# EAGLE design Sensor-node_max (EAGLE 9.6.2)
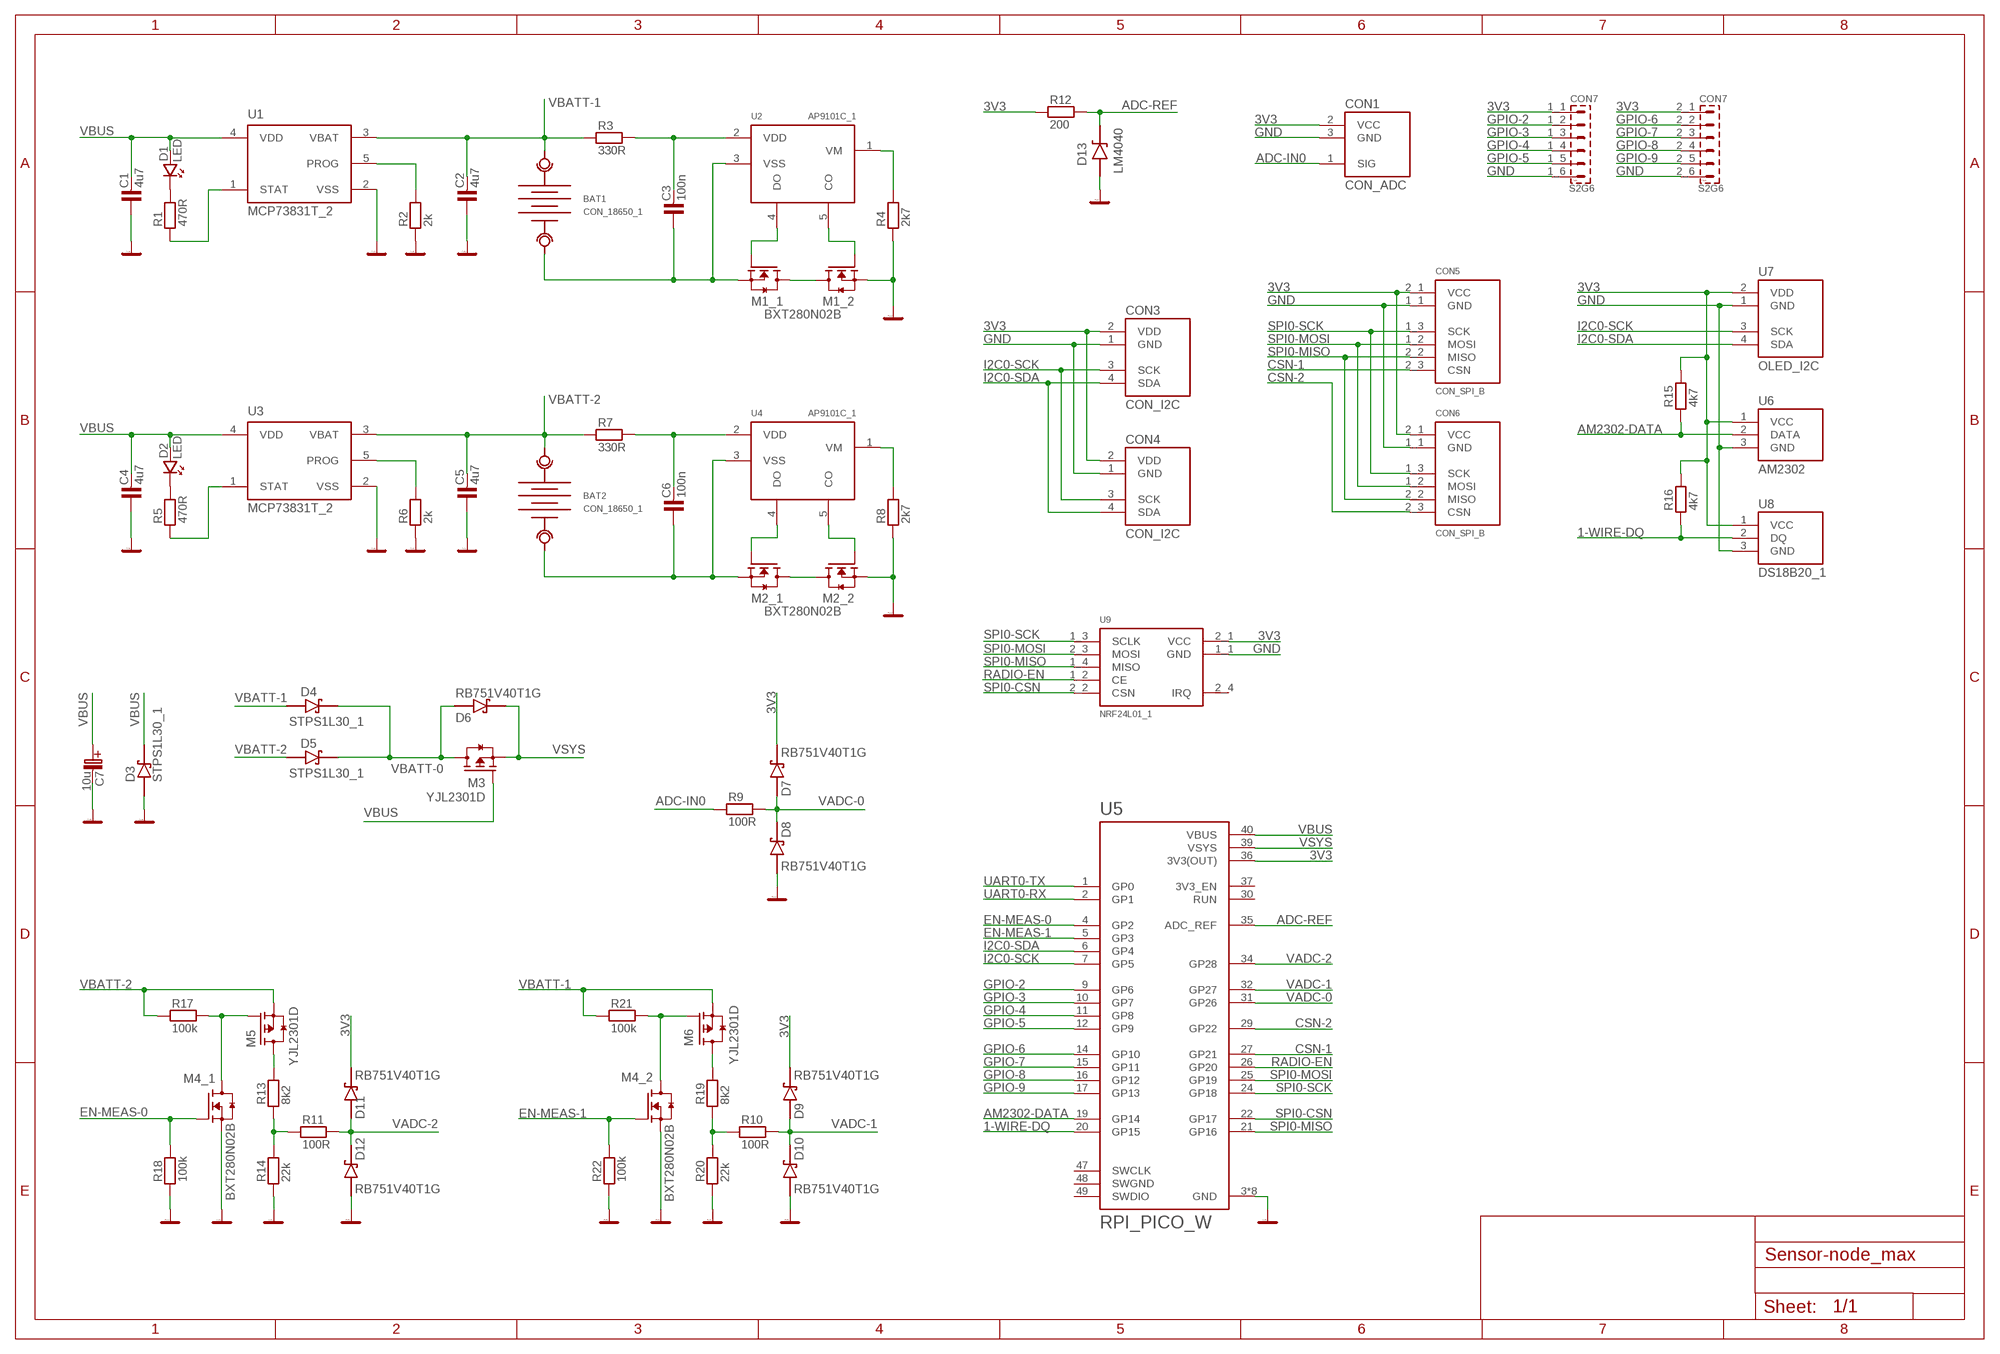
[diagram p0: schematic, sheet 1]

## Parts
BAT1  CON_18650_1  [BATTERY_PADS_1]
BAT2  CON_18650_1  [BATTERY_PADS_1]
C1  4u7  C_KER_0805  [0805]
C2  4u7  C_KER_0805  [0805]
C3  100n  C_KER_0805  [0805]
C4  4u7  C_KER_0805  [0805]
C5  4u7  C_KER_0805  [0805]
C6  100n  C_KER_0805  [0805]
C7  10u  C_EL_SMDD  [C_EL-SMD_D]
CON1  CON_ADC  [ADC_CON]
CON3  CON_I2C  [I2C_CONN]
CON4  CON_I2C  [I2C_CONN]
CON5  CON_SPI_B  [SPI_CONN_2]
CON6  CON_SPI_B  [SPI_CONN_2]
CON7  S2G6  S2G6_JUMP  [S2G6_JUM]
D1  LED  LED_1206  [P1206]
D2  LED  LED_1206  [P1206]
D3  STPS1L30_1  [SMA]
D4  STPS1L30_1  [SMA]
D5  STPS1L30_1  [SMA]
D6  RB751V40T1G  [SOD323]
D7  RB751V40T1G  [SOD323]
D8  RB751V40T1G  [SOD323]
D9  RB751V40T1G  [SOD323]
D10  RB751V40T1G  [SOD323]
D11  RB751V40T1G  [SOD323]
D12  RB751V40T1G  [SOD323]
D13  LM4040  [TRANSISTOR-FET_SOT23]
M1  BXT280N02B  [SO8]
M2  BXT280N02B  [SO8]
M3  YJL2301D  [TRANSISTOR-FET_SOT23]
M4  BXT280N02B  [SO8]
M5  YJL2301D  [TRANSISTOR-FET_SOT23]
M6  YJL2301D  [TRANSISTOR-FET_SOT23]
R1  470R  R_0805  [0805]
R2  2k  R_0805  [0805]
R3  330R  R_0805  [0805]
R4  2k7  R_0805  [0805]
R5  470R  R_0805  [0805]
R6  2k  R_0805  [0805]
R7  330R  R_0805  [0805]
R8  2k7  R_0805  [0805]
R9  100R  R_0805  [0805]
R10  100R  R_0805  [0805]
R11  100R  R_0805  [0805]
R12  200  R_0805  [0805]
R13  8k2  R_0805  [0805]
R14  22k  R_0805  [0805]
R15  4k7  R_0805  [0805]
R16  4k7  R_0805  [0805]
R17  100k  R_0805  [0805]
R18  100k  R_0805  [0805]
R19  8k2  R_0805  [0805]
R20  22k  R_0805  [0805]
R21  100k  R_0805  [0805]
R22  100k  R_0805  [0805]
U1  MCP73831T_2  [GHI-IC_SOT23-5(MICROCHIP)]
U2  AP9101C_1  [GHI-IC_SOT23-5(MICROCHIP)]
U3  MCP73831T_2  [GHI-IC_SOT23-5(MICROCHIP)]
U4  AP9101C_1  [GHI-IC_SOT23-5(MICROCHIP)]
U5  RPI_PICO_W  RASPBERRY_PICO_W_2  [RPI_PICO_W]
U6  AM2302  [AM2302]
U7  OLED_I2C  [I2C_CONN]
U8  DS18B20_1  [DS18B20_CABLE]
U9  NRF24L01_1  [NRF24L01_NORM]

## Nets
1-WIRE-DQ: R16.1 U5.20(GP15) U8.2(DQ)
3V3: CON1.2(VCC) CON3.2(VDD) CON4.2(VDD) CON5.2_1(VCC) CON6.2_1(VCC) CON7.1_1 CON7.2_1 D7.1(C) D9.1(C) D11.1(C) R12.1 R15.2 R16.2 U5.36(3V3(OUT)) U6.1(VCC) U7.2(VDD) U8.1(VCC) U9.2_1(VCC)
ADC-IN0: CON1.1(SIG) R9.1
ADC-IN2: R11.1 R13.1 R14.2
ADC-REF: D13.1(C) R12.2 U5.35(ADC_REF)
AM2302-DATA: R15.1 U5.19(GP14) U6.2(DATA)
CO1: M1.2(_2:G) U2.5(CO)
CO2: M2.2(_2:G) U4.5(CO)
CSN-1: CON5.2_3(CSN) U5.27(GP21)
CSN-2: CON6.2_3(CSN) U5.29(GP22)
DO1: M1.4(_1:G) U2.4(DO)
DO2: M2.4(_1:G) U4.4(DO)
EN-MEAS-0: M4.4(_1:G) R18.2 U5.4(GP2)
EN-MEAS-1: M4.2(_2:G) R22.2 U5.5(GP3)
GND: C1.1 C2.1 C4.1 C5.1 C7.-(C_EL-) CON1.3(GND) CON3.1(GND) CON4.1(GND) CON5.1_1(GND) CON6.1_1(GND) CON7.1_6 CON7.2_6 D3.2(A) D8.2(A) D10.2(A) D12.2(A) D13.2(A) M1.1(_2:S) M2.1(_2:S) M4.1(_2:S) M4.3(_1:S) R2.1 R4.1 R6.1 R8.1 R14.1 R18.1 R20.1 R22.1 U1.2(VSS) U3.2(VSS) U5.3(GND) U5.8(GND) U5.13(GND) U5.18(GND) U5.23(GND) U5.28(GND) U5.33(GND) U5.38(GND) U6.3(GND) U7.1(GND) U8.3(GND) U9.1_1(GND)
GPIO-2: CON7.1_2 U5.9(GP6)
GPIO-3: CON7.1_3 U5.10(GP7)
GPIO-4: CON7.1_4 U5.11(GP8)
GPIO-5: CON7.1_5 U5.12(GP9)
GPIO-6: CON7.2_2 U5.14(GP10)
GPIO-7: CON7.2_3 U5.15(GP11)
GPIO-8: CON7.2_4 U5.16(GP12)
GPIO-9: CON7.2_5 U5.17(GP13)
I2C0-SCK: CON3.3(SCK) CON4.3(SCK) U5.7(GP5) U7.3(SCK)
I2C0-SDA: CON3.4(SDA) CON4.4(SDA) U5.6(GP4) U7.4(SDA)
N$1: D1.K R1.2
N$2: M4.7(_2:D) M4.8(_2:D) M6.1(G) R21.2
N$3: M6.3(D) R19.2
N$4: R10.1 R19.1 R20.2
N$5: D2.K R5.2
N$6: M4.5(_1:D) M4.6(_1:D) M5.1(G) R17.2
N$7: M5.3(D) R13.2
NMOS-CONN-1: M1.5(_1:D) M1.6(_1:D) M1.7(_2:D) M1.8(_2:D)
NMOS-CONN-2: M2.5(_1:D) M2.6(_1:D) M2.7(_2:D) M2.8(_2:D)
P1-: BAT1.GND_1(GND) BAT1.GND_2(GND) C3.1 M1.3(_1:S) U2.3(VSS)
P2-: BAT2.GND_1(GND) BAT2.GND_2(GND) C6.1 M2.3(_1:S) U4.3(VSS)
PROG1: R2.2 U1.5(PROG)
PROG2: R6.2 U3.5(PROG)
RADIO-EN: U5.26(GP20) U9.1_2(CE)
SPI0-CSN: U5.22(GP17) U9.2_2(CSN)
SPI0-MISO: CON5.2_2(MISO) CON6.2_2(MISO) U5.21(GP16) U9.1_4(MISO)
SPI0-MOSI: CON5.1_2(MOSI) CON6.1_2(MOSI) U5.25(GP19) U9.2_3(MOSI)
SPI0-SCK: CON5.1_3(SCK) CON6.1_3(SCK) U5.24(GP18) U9.1_3(SCLK)
STAT1: R1.1 U1.1(STAT)
STAT2: R5.1 U3.1(STAT)
UART0-RX: U5.2(GP1)
UART0-TX: U5.1(GP0)
VADC-0: D7.2(A) D8.1(C) R9.2 U5.31(GP26)
VADC-1: D9.2(A) D10.1(C) R10.2 U5.32(GP27)
VADC-2: D11.2(A) D12.1(C) R11.2 U5.34(GP28)
VBATT-0: D4.1(C) D5.1(C) D6.2(A) M3.3(D)
VBATT-1: BAT1.UCC_1(UCC) BAT1.UCC_2(UCC) C2.2 D4.2(A) M6.2(S) R3.1 R21.1 U1.3(VBAT)
VBATT-2: BAT2.UCC_1(UCC) BAT2.UCC_2(UCC) C5.2 D5.2(A) M5.2(S) R7.1 R17.1 U3.3(VBAT)
VBUS: C1.2 C4.2 C7.+(C_EL+) D1.A D2.A D3.1(C) M3.1(G) U1.4(VDD) U3.4(VDD) U5.40(VBUS)
VDD-AP9101-1: C3.2 R3.2 U2.2(VDD)
VDD-AP9101-2: C6.2 R7.2 U4.2(VDD)
VM1: R4.2 U2.1(VM)
VM2: R8.2 U4.1(VM)
VSYS: D6.1(C) M3.2(S) U5.39(VSYS)
Unconnected: U5.30(RUN) U5.37(3V3_EN) U5.47(SWCLK) U5.49(SWDIO) U9.2_4(IRQ)

## Power pins joined to a net without a drawn wire
SWGND: U5.48(SWGND)

## Library data of the parts
BAT1 BAT2 = #_NG_knihovna:CON_18650
C1-C6 = #_NG_knihovna:C_KER: Kondenzator - keramicky
C7 = #_NG_knihovna:C_EL_SMD
CON1 = #_NG_knihovna:CON_ADC
CON3 CON4 = #_NG_knihovna:CON_I2C
CON5 CON6 = #_NG_knihovna:CON_SPI
CON7 = #PaJa_konektory:S2G6_JUMP: Radove konektory - koliky - dvojite - 2x6
D1 D2 = #_NG_knihovna:LED: LED - jednobarevna
D3-D5 = #_NG_knihovna:STPS1L30
D6-D12 = #_NG_knihovna:RB751V40T1G
D13 = #_NG_knihovna:LM4040
M1 M2 M4 = #_NG_knihovna:BXT280N02B
M3 M5 M6 = #_NG_knihovna:YJL2301D
R1-R22 = #_NG_knihovna:R: Rezistor
U1 U3 = #_NG_knihovna:MCP73831T
U2 U4 = #_NG_knihovna:AP9101C
U5 = #_NG_knihovna:RASPBERRY_PICO_W_2
U6 = #_NG_knihovna:AM2302
U7 = #_NG_knihovna:OLED_I2C
U8 = #_NG_knihovna:DS18B20
U9 = #_NG_knihovna:NRF24L01

## Net classes
0 default: clearance 0.205 mm

## Board
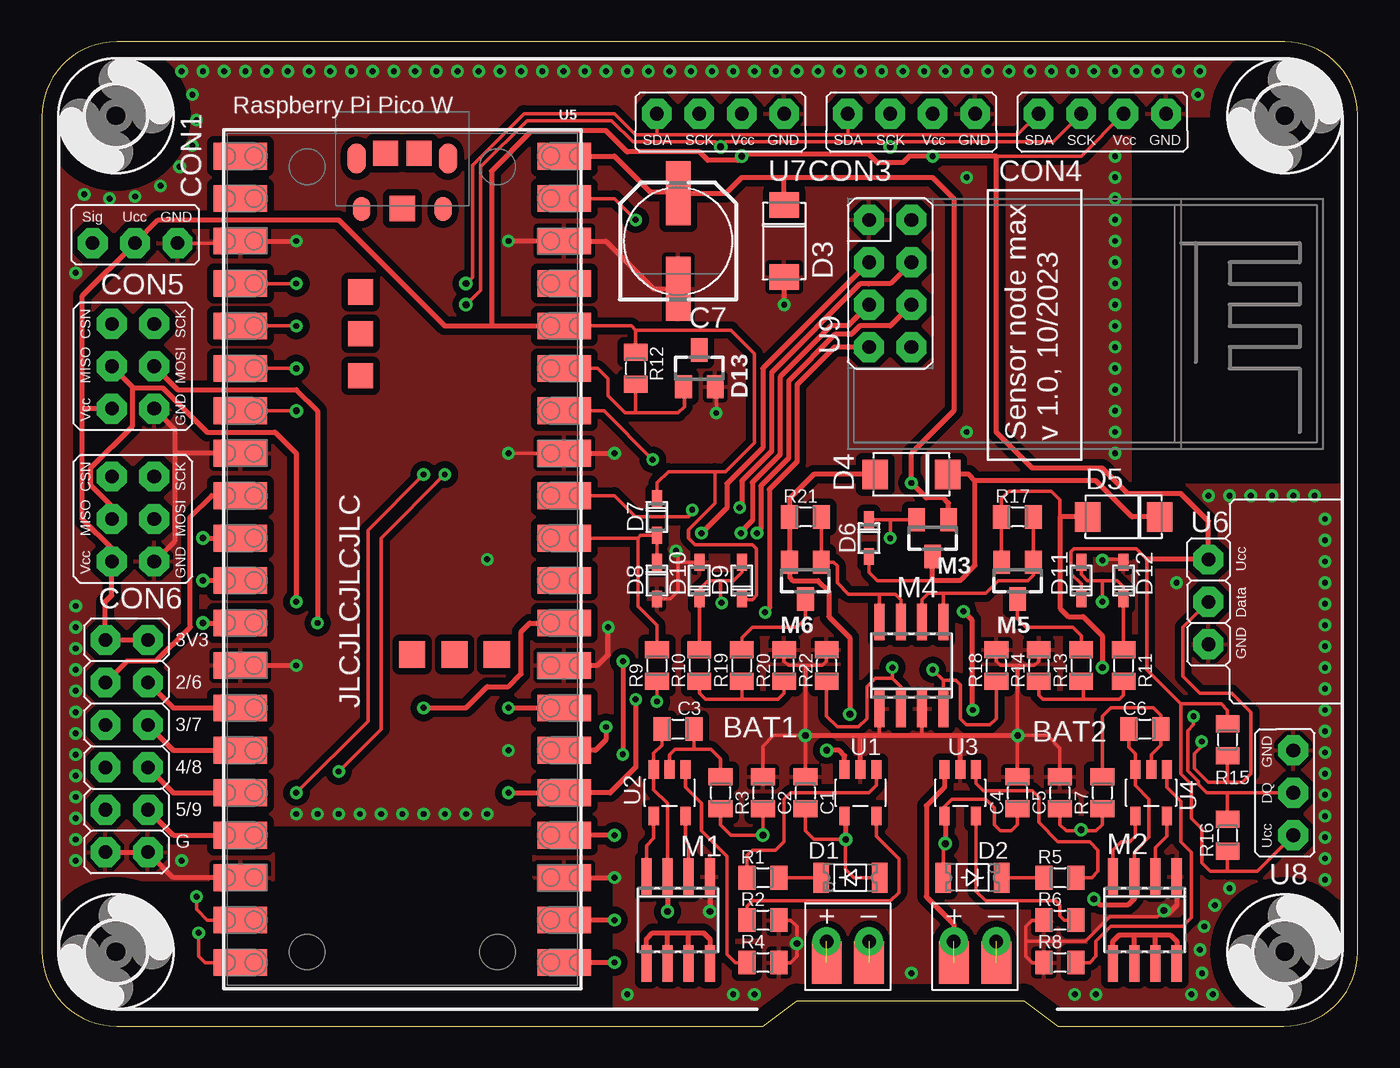
[diagram p1: board, top side]
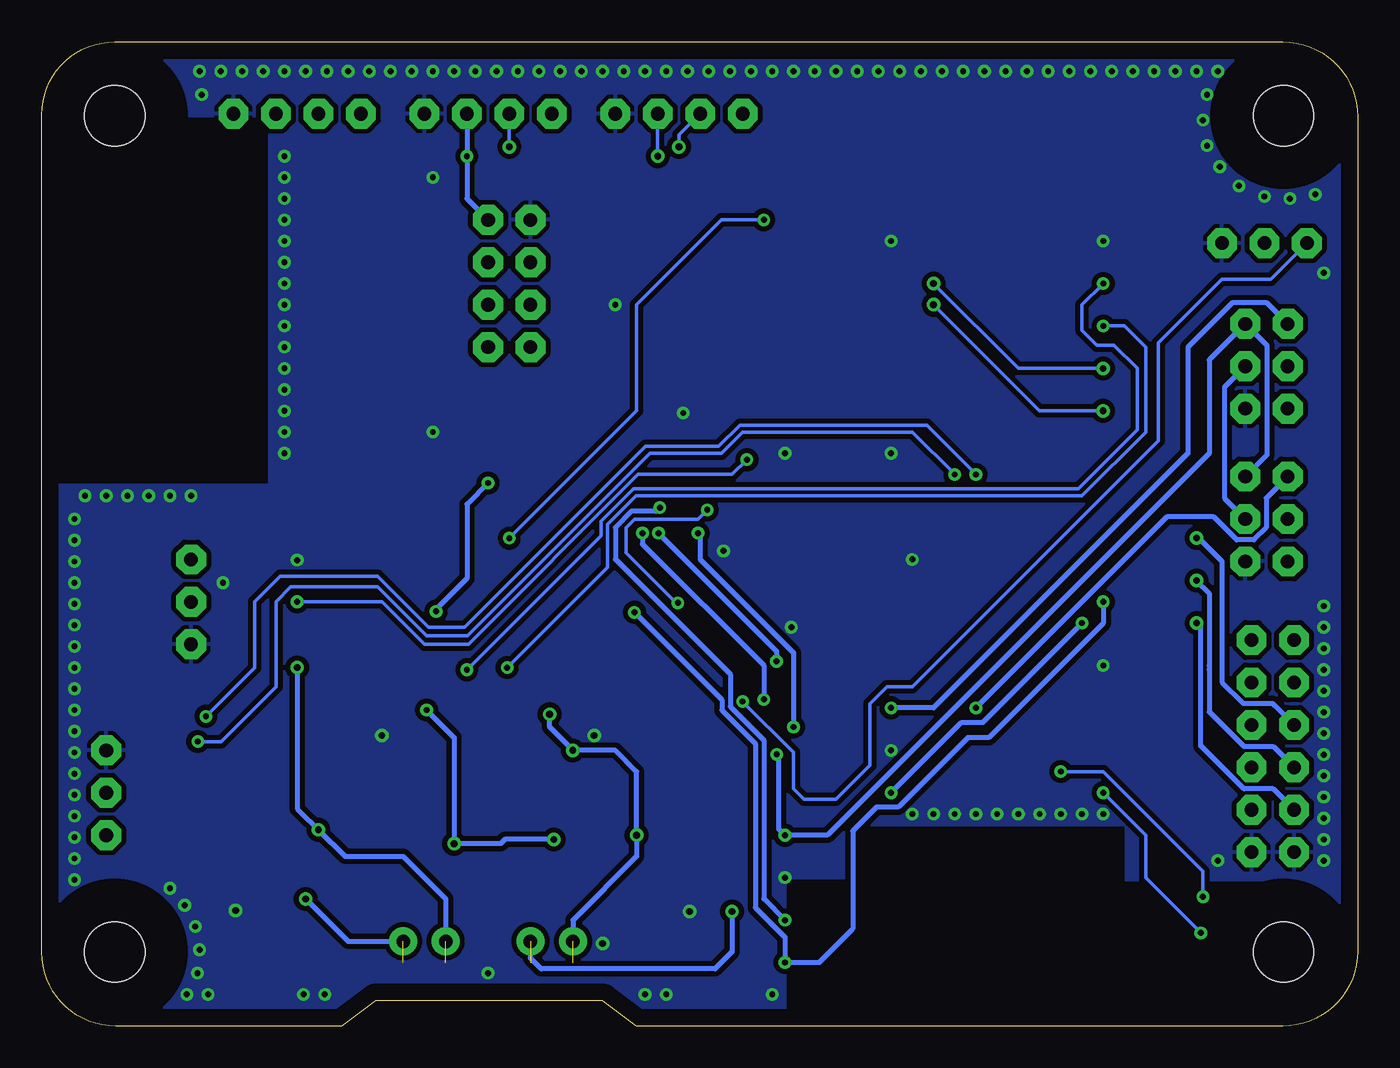
[diagram p2: board, bottom side, seen from below]

Size 78.79 x 58.92 mm. Coordinates in mm from the lower left corner, seen from the top.
Outline: 0,54.44 0,4.5 arc90 4.5,0 43.18,0 45.21,1.52 58.8,1.52 60.83,0 74.37,0 arc90 78.79,4.42 78.79,54.56 arc90 74.43,58.92 4.48,58.92 arc90 0,54.44
Copper layers (1*16): Top 0.035mm / dielectric 1.5mm / Bottom 0.035mm
Design rules "default": minimum track width 6mil, minimum drill 0.35mm, track to track 6mil, track to pad 6mil, pad to pad 6mil, via to via 6mil, smd to smd 6mil, copper to edge 40mil, drill to drill 6mil, minimum pad ring 10mil, minimum via ring 8mil, stop-mask expansion 4mil, vias tented up to drill 0mil, thermal gap 10mil

### Footprints (pad centres in the part's own frame; a part is rotated, then mirrored left to right if it is on the bottom)
BATTERY_PADS_1 = smd 1.778 x 2.54: GND_1 1.27,0; UCC_1 -1.27,0 | drill 0.813 pad 1.676: GND_2 1.27,1.27; UCC_2 -1.27,1.27
0805 = smd 1.016 x 1.422: 1 -0.953,0; 2 0.953,0
C_EL-SMD_D = smd 3.81 x 1.473: + 2.857,0; - -2.857,0
ADC_CON = drill 0.813 pad 1.778 octagon: 1 -2.54,0; 2 0,0; 3 2.54,0
I2C_CONN = drill 0.813 pad 1.778 octagon: 1 -3.81,0; 2 -1.27,0; 3 1.27,0; 4 3.81,0
SPI_CONN_2 = drill 0.813 pad 1.778 octagon: 1_1 -2.54,-1.27; 1_2 0,-1.27; 1_3 2.54,-1.27; 2_1 -2.54,1.27; 2_2 0,1.27; 2_3 2.54,1.27
S2G6_JUM = drill 0.813 pad 1.778 octagon: 1_1 -6.35,-1.27; 1_2 -3.81,-1.27; 1_3 -1.27,-1.27; 1_4 1.27,-1.27; 1_5 3.81,-1.27; 1_6 6.35,-1.27; 2_1 -6.35,1.27; 2_2 -3.81,1.27; 2_3 -1.27,1.27; 2_4 1.27,1.27; 2_5 3.81,1.27; 2_6 6.35,1.27
P1206 = smd 0.914 x 1.778: A -1.905,0; K 1.587,0
SMA = smd 1.524 x 1.778: 1 -2.159,0; 2 2.159,0
SOD323 = smd 1 x 0.6: 1 -1.1,0; 2 1.1,0
TRANSISTOR-FET_SOT23 = smd 1 x 1.4: 1 -0.95,-1.1; 2 0.95,-1.1; 3 0,1.1
SO8 = smd 0.6 x 2.2: 1 -1.905,-2.6; 2 -0.635,-2.6; 3 0.635,-2.6; 4 1.905,-2.6; 5 1.905,2.6; 6 0.635,2.6; 7 -0.635,2.6; 8 -1.905,2.6
GHI-IC_SOT23-5(MICROCHIP) = smd 0.6 x 1.1: 1 -0.95,-1.4; 2 0,-1.4; 3 0.95,-1.4; 4 0.95,1.4; 5 -0.95,1.4
RPI_PICO_W = smd 3.2 x 1.6: 1 -9.69,24.13; 2 -9.69,21.59; 3 -9.69,19.05; 4 -9.69,16.51; 5 -9.69,13.97; 6 -9.69,11.43; 7 -9.69,8.89; 8 -9.69,6.35; 9 -9.69,3.81; 10 -9.69,1.27; 11 -9.69,-1.27; 12 -9.69,-3.81; 13 -9.69,-6.35; 14 -9.69,-8.89; 15 -9.69,-11.43; 16 -9.69,-13.97; 17 -9.69,-16.51; 18 -9.69,-19.05; 19 -9.69,-21.59; 20 -9.69,-24.13; 21 9.69,-24.13; 22 9.69,-21.59; 23 9.69,-19.05; 24 9.69,-16.51; 25 9.69,-13.97; 26 9.69,-11.43; 27 9.69,-8.89; 28 9.69,-6.35; 29 9.69,-3.81; 30 9.69,-1.27; 31 9.69,1.27; 32 9.69,3.81; 33 9.69,6.35; 34 9.69,8.89; 35 9.69,11.43; 36 9.69,13.97; 37 9.69,16.51; 38 9.69,19.05; 39 9.69,21.59; 40 9.69,24.13 | smd 1.5 x 1.5: 41 0,21; 42 1,24.3; 43 -1,24.3; 44 -2.5,16; 45 -2.5,13.5; 46 -2.5,11 | smd 1.575 x 1.575: 47 0.584,-5.7; 48 3.124,-5.7; 49 5.664,-5.7 | smd 1.1 x 1.8: A -2.725,24; B 2.725,24 | smd 1.05 x 1.45: C -2.425,20.97; D 2.425,20.97
AM2302 = drill 0.813 pad 1.778 octagon: 1 -2.54,0; 2 0,0; 3 2.54,0
DS18B20_CABLE = drill 0.813 pad 1.778 octagon: 1 -2.54,0; 2 0,0; 3 2.54,0
NRF24L01_NORM = drill 0.813 pad 1.778 octagon: 1_1 -3.81,-1.27; 1_2 -1.27,-1.27; 1_3 1.27,-1.27; 1_4 3.81,-1.27; 2_1 -3.81,1.27; 2_2 -1.27,1.27; 2_3 1.27,1.27; 2_4 3.81,1.27
3,6 = hole 3.6: 0,0

### Placement (x,y rotation side)
BAT1  48.26,3.81 0 top
BAT2  55.88,3.81 0 top
C1  45.72,13.97 270 top
C2  43.18,13.97 270 top
C3  38.1,17.78 0 top
C4  58.42,13.97 270 top
C5  60.96,13.97 270 top
C6  66.04,17.78 0 top
C7  38.1,46.99 90 top
CON1  5.59,46.86 0 top
CON3  52.07,54.61 180 top
CON4  63.5,54.61 180 top
CON5  5.46,39.5 90 top
CON6  5.46,30.35 90 top
CON7  5.08,16.76 270 top
D1  48.26,8.89 180 top
D2  55.88,8.89 0 top
D3  44.45,46.99 270 top
D4  52.07,33.02 180 top
D5  64.77,30.48 180 top
D6  49.53,29.21 270 top
D7  36.83,30.48 270 top
D8  36.83,26.67 270 top
D9  41.91,26.67 90 top
D10  39.37,26.67 90 top
D11  62.23,26.67 90 top
D12  64.77,26.67 90 top
D13  39.37,39.37 0 top
M1  38.1,6.35 180 top
M2  66.04,6.35 180 top
M3  53.34,29.21 180 top
M4  52.07,21.59 0 top
M5  58.42,26.67 180 top
M6  45.72,26.67 180 top
R1  43.18,8.89 0 top
R2  43.18,6.35 180 top
R3  40.64,13.97 90 top
R4  43.18,3.81 180 top
R5  60.96,8.89 180 top
R6  60.96,6.35 0 top
R7  63.5,13.97 90 top
R8  60.96,3.81 0 top
R9  36.83,21.59 90 top
R10  39.37,21.59 90 top
R11  64.77,21.59 90 top
R12  35.56,39.37 270 top
R13  62.23,21.59 90 top
R14  59.69,21.59 270 top
R15  70.99,17.14 90 top
R16  70.99,11.43 270 top
R17  58.42,30.48 0 top
R18  57.15,21.59 270 top
R19  41.91,21.59 90 top
R20  44.45,21.59 270 top
R21  45.72,30.48 0 top
R22  46.99,21.59 270 top
U1  49.02,13.97 180 top
U2  37.59,13.97 180 top
U3  54.99,13.97 180 top
U4  66.42,13.97 180 top
U5  21.59,27.94 0 top
U6  69.85,25.4 270 top
U7  40.64,54.61 180 top
U8  74.93,13.97 90 top
U9  50.8,44.45 270 top
U$1  [3,6]  74.42,4.45 0 top
U$2  [3,6]  4.45,54.48 0 top
U$3  [3,6]  4.45,4.45 0 top
U$4  [3,6]  74.42,54.48 0 top

### Tracks (layer width: path | path; a pad name or v marks a point on that pad's centre or on a via)
1-WIRE-DQ  (via drill 0.35)
  Top 0.2: U8.2 70.99,13.97 | R16.1 70.99,13.97 | U5.20 9.78,3.81 9.4,4.19 v9.4,5.59 | v68.96,18.54 68.96,18.03 68.6,17.68 68.6,15.28 69.24,14.65 69.24,14.48 69.75,13.97 70.99,13.97 | v22.86,33.02 19.53,29.69 19.53,18.26 v15.24,13.97
  Bottom 0.2: v68.96,18.54 66.04,21.46 66.04,25.4 64.52,26.92 58.67,26.92 55.63,23.88 53.47,23.88 42.65,34.7 38.27,34.7 37,35.97 25.8,35.97 v22.86,33.02 | v15.24,13.97 12.7,11.43 12.7,8.89 v9.4,5.59
3V3  (via drill 0.35, 0.4 pad 0.5)
  Top 0.2: D11.1 62.23,26.48 61.62,27.08 61.62,28.4 61.8,28.57 65.53,28.57 66.17,27.94 66.17,21.34 68.2,19.3 | D9.1 41.95,25.53 42.55,25.53 42.8,25.78 42.8,28.57 42.55,28.83 39.12,28.83 38.73,29.21 38.73,29.72 40.31,31.29 40.31,33.2 | 35.56,41.66 R12.1 | U5.36 35.31,41.91 35.56,41.66 | U8.1 72.77,9.27 70.99,9.27 | 70.99,9.27 69.98,9.27 69.47,9.78 69.47,11.81 68.83,12.45 68.83,14.48 68.2,15.11 68.2,19.3 | R16.2 70.99,9.27 | R15.2 70.99,18.92 70.61,19.3 68.2,19.3 | 57.15,52.07 62.23,52.07 CON4.2 | 35.56,41.66 41.27,41.66 42.67,40.26 42.67,34.92 40.94,33.2 40.31,33.2 | D7.1 36.83,32.51 37.51,33.2 40.31,33.2
  Top 0.305: CON7.2_1 CON7.1_1 3.81,25.4 4.19,25.78 CON6.2_1 4.19,28.59 2.44,30.35 2.44,36.96 | 2.44,36.96 2.44,43.71 CON1.2 6.99,48.26 17.78,48.26 24.13,41.91 26.92,41.91 | CON5.2_1 2.44,36.96 | 26.92,41.91 U5.36 | 26.92,41.91 26.92,51.18 29.34,53.59 33.78,53.59 35.05,52.32 39.37,52.32 39.88,51.82 41.66,51.82 v41.91,52.07 42.04,52.2 49.53,52.2 50.04,51.69 51.56,51.69 51.94,52.07 v53.34,52.07 57.15,52.07 57.15,35.56 59.31,33.4 63.5,33.4 65.02,31.88 68.2,31.88 69.85,30.23 U6.1 66.17,27.94
  Bottom 0.2: v41.91,52.07 U7.2
  Bottom 0.305: CON3.2 v53.34,52.07 53.34,49.53 U9.2_1
ADC-IN0  (via drill 0.35)
  Top 0.2: v36.83,19.43 R9.1
  Bottom 0.2: CON1.1 5.21,44.7 8.13,44.7 11.94,40.89 11.94,35.05 26.67,20.32 28.19,20.32 29.21,19.3 29.21,15.62 31.24,13.59 33.15,13.59 33.78,14.22 33.78,16.38 v36.83,19.43
ADC-IN2
  Top 0.2: 62.36,19.56 59.94,19.56 59.69,19.81 R14.2 | 62.36,19.56 64.52,19.56 64.77,19.81 R11.1 | R13.1 62.36,20.51 62.36,19.56
ADC-REF
  Top 0.2: U5.35 33.27,39.37 33.91,38.73 33.91,37.72 34.92,36.7 35.56,36.7 | D13.1 38.38,38.23 38.48,38.12 38.48,37.08 38.1,36.7 35.56,36.7 | R12.2 35.56,36.7
AM2302-DATA  (via drill 0.35)
  Top 0.2: U6.2 68.33,23.88 68.33,20.95 69.34,19.94 71.25,19.94 72.39,18.8 72.39,15.11 71.88,14.61 70.99,14.61 | U5.19 9.91,6.35 9.27,6.99 v9.27,7.75 | v69.45,17.04 69.45,16.75 69.01,16.3 69.01,15.45 69.85,14.61 70.99,14.61 | R15.1 70.99,14.61 | v24.13,33.02 20.32,29.21 20.32,17.78 v17.78,15.24
  Bottom 0.2: v69.45,17.04 68.05,17.04 64.77,20.32 64.77,25.4 63.88,26.29 58.67,26.29 55.75,23.37 53.3,23.37 42.38,34.29 38.1,34.29 36.83,35.56 26.67,35.56 v24.13,33.02 | v17.78,15.24 15.24,15.24 9.27,9.27 v9.27,7.75
CO1
  Top 0.2: U2.5 38.54,11.12 38.73,10.92 M1.2
CO2
  Top 0.2: U4.5 67.37,11.36 66.67,10.67 M2.2
CSN-1  (via drill 0.35)
  Top 0.305: v27.94,19.05 U5.27
  Bottom 0.305: CON5.2_3 5.44,43.28 7.52,43.28 10.16,40.64 10.16,34.29 25.4,19.05 v27.94,19.05
CSN-2  (via drill 0.35)
  Top 0.305: v22.86,19.05 25.4,19.05 26.67,20.32 27.94,20.32 28.7,21.08 28.7,23.62 29.21,24.13 U5.29
  Bottom 0.305: CON6.2_3 5.49,31.6 5.49,29.84 6.21,29.11 7.25,29.11 8.62,30.48 11.43,30.48 v22.86,19.05
DO1
  Top 0.2: M1.4 36.2,10.79 36.64,11.24 U2.4
DO2
  Top 0.2: U4.4 65.47,11.37 65.15,11.05 64.64,11.05 64.14,10.54 M2.4
EN-MEAS-0  (via drill 0.35)
  Top 0.2: 53.98,20.7 M4.4 | 53.98,20.7 54.74,20.7 54.99,20.45 54.99,18.41 55.37,18.03 56.77,18.03 57.15,18.41 R18.2 | 53.98,20.7 v53.34,21.34 | v15.24,44.45 U5.4
  Bottom 0.2: v53.34,21.34 45.31,29.36 45.31,30.21 43.37,32.16 16.74,32.16 13.21,35.69 13.21,39.37 14.61,40.77 15.62,40.77 16.51,41.66 16.51,43.18 v15.24,44.45
EN-MEAS-1  (via drill 0.35)
  Top 0.2: M4.2 51.44,20.32 50.93,20.83 | R22.2 46.99,18.54 47.62,17.91 48.9,17.91 49.4,18.41 49.4,20.32 49.91,20.83 50.93,20.83 | 50.93,20.83 v50.93,21.46 | v15.24,41.91 U5.5
  Bottom 0.2: v50.93,21.46 44.91,27.48 44.91,30.05 43.2,31.75 16.51,31.75 12.7,35.56 12.7,40.64 13.97,41.91 v15.24,41.91
GND  (via drill 0.35, 0.4 pad 0.5)
  Top 0.2: v67.18,6.93 66.8,6.55 63.95,6.55 62.48,5.08 58.93,5.08 | 58.93,5.08 58.93,5.97 59.31,6.35 R6.1 | 58.93,5.08 58.93,4.19 59.31,3.81 R8.1 | R4.1 44.83,3.81 45.21,4.19 v45.21,4.95 45.21,5.97 44.83,6.35 R2.1 | v45.72,17.4 43.81,17.4 43.18,16.76 C2.1 | v58.42,17.4 60.2,17.4 60.96,16.64 C5.1 | R20.1 44.45,21.84 44.7,21.59 45.72,21.59 | 45.72,21.59 46.74,21.59 46.99,21.84 R22.1 | 45.72,21.59 v45.72,17.4 | 58.42,21.59 57.4,21.59 57.15,21.84 R18.1 | 58.42,21.59 59.44,21.59 59.69,21.84 R14.1 | v58.42,17.4 58.42,21.59 | v45.72,17.4 C1.1 | M4.3 52.7,17.4 | M4.1 50.16,17.4 | C4.1 v58.42,17.4 | D8.2 37.63,25.57 38.1,26.04 38.1,27.81 | U5.3 11.77,46.86 CON1.3 | D12.2 64.6,27.94 63.5,27.94 v63.5,27.89 | v37.97,28.45 38.1,28.32 38.1,27.81 | 38.1,27.81 38.14,27.77 D10.2 | D13.2 40.39,38.2 v40.39,36.7 | v34.29,34.29 v27.94,34.29
  Top 0.305: CON7.1_6 CON7.2_6 7.87,8.89 U5.18 | CON6.1_1 7.98,29.06 7.98,34.29 | CON5.1_1 7.98,35.71 7.98,34.29 | M2.1 67.94,7.24 67.41,6.7 v67.18,6.93 | M1.1 v40.01,6.86 | v45.72,17.4 49.02,17.4 | 49.02,17.4 50.16,17.4 52.7,17.4 54.99,17.4 | 54.99,17.4 v58.42,17.4 | U3.2 54.99,17.4 | U1.2 49.02,17.4 | C7.- 36.64,44.13 33.78,46.99 U5.38 v27.94,46.99 | U5.8 7.98,34.29 | U5.3 v15.24,46.99 | U5.13 v15.24,21.59 | D3.2 v44.45,43.18 | U5.23 v34.29,8.89 | v33.91,23.88 33.91,22.23 33.27,21.59 U5.28 | U5.33 v34.29,34.29
  other vias: 26.67,27.94 24.13,12.7 15.24,12.7 16.51,12.7 17.78,12.7 19.05,12.7 21.59,12.7 20.32,12.7 22.86,12.7 25.4,12.7 26.67,12.7 64.26,49.53 64.26,46.99 64.26,52.07 64.26,50.8 69.34,57.15 68.07,57.15 66.8,57.15 65.53,57.15 64.26,57.15 62.99,57.15 61.72,57.15 60.45,57.15 59.18,57.15 57.91,57.15 56.64,57.15 55.37,57.15 54.1,57.15 52.83,57.15 51.56,57.15 64.26,48.26 64.26,45.72 64.26,44.45 64.26,43.18 64.26,41.91 64.26,35.56 64.26,36.83 64.26,38.1 64.26,39.37 64.26,40.64 64.26,34.29 69.85,31.75 71.12,31.75 72.39,31.75 76.83,30.35 76.2,31.75 76.83,24 73.66,31.75 74.93,31.75 76.83,29.08 76.83,27.81 76.83,26.54 76.83,25.27 76.83,22.73 76.83,21.46 76.83,8.76 76.83,10.03 76.83,11.3 76.83,16.38 76.83,13.84 76.83,12.57 76.83,15.11 76.83,17.65 76.83,20.19 76.83,18.92 71.12,8.26 70.23,7.24 69.6,5.97 69.34,4.57 69.47,3.17 68.83,1.91 70.1,1.91 63.12,1.91 61.85,1.91 52.07,3.17 42.67,1.91 41.4,1.91 35.05,1.91 50.29,57.15 49.02,57.15 47.75,57.15 46.48,57.15 45.21,57.15 43.94,57.15 42.67,57.15 41.4,57.15 40.13,57.15 38.86,57.15 37.59,57.15 36.32,57.15 35.05,57.15 33.78,57.15 32.51,57.15 31.24,57.15 29.97,57.15 28.7,57.15 27.43,57.15 26.16,57.15 24.89,57.15 23.62,57.15 22.35,57.15 21.08,57.15 19.81,57.15 18.54,57.15 17.27,57.15 16,57.15 14.73,57.15 10.92,57.15 12.19,57.15 9.65,57.15 2.03,45.09 2.03,25.15 2.03,23.88 2.03,22.61 2.03,21.34 2.03,20.07 2.03,18.8 2.03,17.53 2.03,16.26 2.03,14.99 2.03,13.72 2.03,12.45 2.03,11.18 2.03,9.91 8.38,9.91 8.38,57.15 9.02,55.75 9.27,54.23 9.02,52.7 8.26,51.44 7.11,50.29 5.59,49.66 4.06,49.53 2.54,49.78 69.22,55.75 55.37,50.8 55.37,35.56 67.94,26.54 27.94,16.51 13.46,57.15
  pour Top (isolate 0.406): 4.45,58.93 arc-90 8.89,54.48 8.89,54.36 arc-90 4.57,50.04 4.45,50.04 arc-90 0.13,54.36 0.13,54.48 0,4.32 arc-90 4.45,8.76 13.84,8.76 13.84,12.06 29.46,12.06 29.46,8.89 34.29,8.89 34.29,0 43.18,0 45.21,1.52 58.8,1.52 60.83,0 74.42,0 arc-90 69.98,4.45 arc-90 74.42,8.89 arc-90 78.74,4.57 78.74,32.38 65.15,32.38 65.15,54.48 69.98,54.48 arc-90 74.42,58.93
  pour Bottom (isolate 0.305): 4.45,58.93 arc-90 8.89,54.48 8.89,54.36 arc-90 4.57,50.04 4.45,50.04 arc-90 0.13,54.36 0.13,54.48 0,4.32 arc-90 4.45,8.76 13.84,8.76 13.84,12.06 29.46,12.06 29.46,8.89 34.29,8.89 34.29,0 43.18,0 45.21,1.52 58.8,1.52 60.83,0 74.42,0 arc-90 69.98,4.45 arc-90 74.42,8.89 arc-90 78.74,4.57 78.74,32.38 65.15,32.38 65.15,54.48 69.98,54.48 arc-90 74.42,58.93
GPIO-2
  Top 0.305: CON7.1_2 5.1,21.87 6.87,21.87 8.89,23.89 8.89,30.48 10.16,31.75 U5.9
GPIO-3  (via drill 0.4 pad 0.5)
  Top 0.305: v9.65,29.21 U5.10
  Bottom 0.305: CON7.1_3 4.95,19.18 5.1,19.33 6.87,19.33 8.13,20.59 8.13,27.81 9.53,29.21 v9.65,29.21
GPIO-4  (via drill 0.4 pad 0.5)
  Top 0.305: U5.11 v9.65,26.67
  Bottom 0.305: v9.65,26.67 8.89,25.91 8.89,21.59 8.89,21.35 8.89,18.81 6.82,16.74 5.06,16.74 CON7.1_4
GPIO-5  (via drill 0.4 pad 0.5)
  Top 0.305: v9.65,24.13 U5.12
  Bottom 0.305: CON7.1_5 5.06,14.2 6.82,14.2 9.4,16.78 9.4,23.88 v9.65,24.13
GPIO-6
  Top 0.305: CON7.2_2 7.87,19.05 U5.14
GPIO-7
  Top 0.305: CON7.2_3 7.87,16.51 U5.15
GPIO-8
  Top 0.305: CON7.2_4 7.87,13.97 U5.16
GPIO-9
  Top 0.305: CON7.2_5 7.87,11.43 U5.17
I2C0-SCK  (via drill 0.4 pad 0.5)
  Top 0.2: CON4.3 60.55,52.94 51.1,52.94 v50.8,52.63 50.62,52.63 50.32,52.94 40.94,52.94 v40.64,52.63 40.34,52.94 35.39,52.94 34.12,54.2 29.04,54.2 26.27,51.43 26.27,44.05 v25.4,43.18 | v15.24,36.83 U5.7
  Bottom 0.2: v50.8,52.63 CON3.3 | v40.64,52.63 40.64,53.34 U7.3 | v25.4,43.18 19.05,36.83 v15.24,36.83
I2C0-SDA  (via drill 0.4 pad 0.5)
  Top 0.2: CON4.4 58.42,53.34 48.26,53.34 | 48.26,53.34 36.83,53.34 | 36.83,53.34 35.56,53.34 34.29,54.61 28.87,54.61 25.78,51.52 25.78,44.83 v25.4,44.45 | 36.83,53.34 U7.4 | 48.26,53.34 CON3.4 | U5.6 v15.24,39.37
  Bottom 0.2: v25.4,44.45 20.32,39.37 v15.24,39.37
N$1
  Top 0.2: R1.2 D1.K
N$2
  Top 0.2: 50.16,25.86 51.1,25.86 51.44,25.53 M4.7 | M4.8 50.16,25.86 | 50.16,25.86 48.3,25.86 47.62,26.54 47.62,27.56 47.41,27.77 M6.1 R21.2
N$3
  Top 0.2: R19.2 41.91,23.24 42.55,23.88 45.21,23.88 45.72,24.38 M6.3
N$4
  Top 0.2: R10.1 39.37,19.94 39.75,19.56 41.91,19.56 | 41.91,19.56 44.07,19.56 44.45,19.94 R20.2 | R19.1 41.91,19.56
N$5
  Top 0.2: D2.K R5.2
N$6
  Top 0.2: R17.2 M5.1 59.37,26.98 59.05,26.67 57.28,26.67 56.52,25.91 53.98,25.91 | M4.6 52.7,25.53 53.09,25.91 53.98,25.91 | M4.5 53.98,25.91
N$7
  Top 0.2: M5.3 58.42,24.38 58.93,23.88 61.72,23.88 62.23,23.37 R13.2
NMOS-CONN-1
  Top 0.305: M1.5 36.2,5.21 36.58,5.59 37.47,5.59 | 37.47,5.59 38.73,5.59 | 38.73,5.59 39.62,5.59 40.01,5.21 M1.8 | M1.7 38.73,5.59 | M1.6 37.47,5.59
NMOS-CONN-2
  Top 0.305: M2.5 64.14,5.08 64.52,5.46 65.41,5.46 | 65.41,5.46 66.67,5.46 | 66.67,5.46 67.56,5.46 67.94,5.08 M2.8 | M2.7 66.67,5.46 | M2.6 65.41,5.46
P1-  (via drill 0.4 pad 0.5)  (1 unrouted)
  Top 0.2: C3.1 37.15,16.83 36.64,16.32 U2.3 36.64,14.16 37.47,13.34 M1.3
  Top 0.305: M1.3 v37.47,6.86
  Bottom 0.305: v37.47,6.86 37.47,4.45 38.48,3.43 48.9,3.43 49.53,4.06 BAT1.GND_2
P2-  (via drill 0.4 pad 0.5)  (1 unrouted)
  Top 0.2: C6.1 65.09,16.7 65.47,16.32 U4.3 65.47,14.41 66.29,13.59 66.29,11.3 65.41,10.41 M2.3
  Top 0.305: M2.3 65.41,7.62 65.02,7.24 63.37,7.24 v62.99,7.62
  Bottom 0.305: v62.99,7.62 60.45,5.08 BAT2.GND_2
PROG1
  Top 0.2: U1.5 49.97,11.37 51.31,10.03 51.31,8 50.8,7.49 42.55,7.49 42.23,7.18 R2.2
PROG2
  Top 0.2: U3.5 55.94,8.07 56.52,7.49 60.71,7.49 60.96,7.24 60.96,6.6 61.21,6.35 R6.2
RADIO-EN  (via drill 0.35)
  Top 0.305: U9.1_2 43.18,39.37 43.18,34.63 41.02,32.47 41.02,31.03 v39.5,29.51 | v33.78,17.91 33.78,17.14 33.15,16.51 U5.26
  Bottom 0.305: v39.5,29.51 39.37,29.39 39.37,27.94 33.78,22.35 v33.78,17.91
SPI0-CSN  (via drill 0.35)
  Top 0.305: U9.2_2 50.8,44.45 49.53,44.45 49.51,44.43 49,44.43 43.69,39.12 43.69,34.42 41.91,32.64 41.91,31.16 v41.78,31.04 | v34.29,6.35 U5.22
  Bottom 0.305: v41.78,31.04 42.01,30.81 43.5,30.81 44.45,29.86 44.45,27.94 37.57,21.06 37.57,19.13 35.56,17.12 35.56,7.62 v34.29,6.35
SPI0-MISO  (via drill 0.35)
  Top 0.305: CON6.2_2 4.19,31.13 2.94,32.38 2.94,33.42 5.44,35.92 5.44,38.25 | CON5.2_2 5.44,38.25 | 5.44,38.25 5.49,38.2 7.25,38.2 9.89,35.56 13.97,35.56 15.24,34.29 v15.24,25.4 | v34.29,3.81 U5.21 | U9.1_4 47.46,40.64 45.22,38.4 45.22,33.79 43.56,32.13 43.56,25.02 v43.31,24.77
  Bottom 0.305: v15.24,25.4 15.24,24.13 22.1,17.27 23.34,17.27 27.51,13.11 28.8,13.11 30.23,11.68 30.23,5.84 32.26,3.81 v34.29,3.81 34.29,5.31 36.07,7.09 36.07,16.91 38.08,18.91 38.08,19.53 v43.31,24.77
SPI0-MOSI  (via drill 0.35)
  Top 0.305: CON5.1_2 8.13,38.1 15.24,38.1 16.51,36.83 v16.51,24.13 | v27.94,13.97 U5.25 34.04,13.97 35.56,15.49 v35.56,19.56 | U9.2_3 50.8,41.91 48.98,41.91 48.47,41.4 47.5,41.4 44.71,38.61 44.71,34 43.05,32.34 43.05,29.74 v42.83,29.51
  Bottom 0.305: CON5.1_2 7.98,38.25 7.98,31.6 CON6.1_2 | v16.51,24.13 16.51,24.11 22.43,18.19 23.72,18.19 v27.94,13.97 | v42.83,29.51 42.83,28.86 35.56,21.59 v35.56,19.56
SPI0-SCK  (via drill 0.35)
  Top 0.305: v34.29,11.43 U5.24 | U9.1_3 48.26,41.91 47.24,41.91 44.2,38.87 44.2,34.21 42.54,32.55 42.54,30.27 42.09,29.82 42.09,29.74 v41.86,29.51 | v34.8,21.84 v34.8,16.28 v34.79,16.27
  Bottom 0.305: CON6.1_3 5.44,34.19 5.44,40.74 CON5.1_3 8.89,39.88 8.89,34.29 31.75,11.43 v34.29,11.43 34.67,11.81 34.67,16.15 v34.79,16.27 | v41.86,29.51 34.8,22.45 v34.8,21.84
STAT1
  Top 0.2: U1.1 49.97,14.41 49.53,13.97 44.83,13.97 44.45,13.59 44.45,11.05 43.94,10.54 42.55,10.54 42.23,10.22 R1.1
STAT2
  Top 0.2: R5.1 62.87,8.89 63.25,9.27 63.25,10.54 62.74,11.05 60.83,11.05 59.69,12.19 59.69,13.72 59.31,14.1 56.39,14.1 55.94,14.54 U3.1
VADC-0
  Top 0.2: D8.1 D7.2 35.86,29.38 35.69,29.21 | U5.31 35.69,29.21 | 35.69,29.21 35.69,25.15 36.83,24 R9.2
VADC-1  (via drill 0.35)
  Top 0.2: R10.2 D10.1 39.37,26.16 39.88,26.67 40.64,26.67 | D9.2 41.91,27.18 41.4,26.67 40.64,26.67 | U5.32 34.29,31.75 35.56,30.48 38.73,30.48 38.95,30.7 v38.95,30.9 | v40.7,25.34 40.64,25.4 40.64,26.67
  Bottom 0.2: v38.95,30.9 39.5,30.35 43.31,30.35 43.81,29.84 43.81,28.32 40.77,25.27 v40.7,25.34
VADC-2  (via drill 0.35)
  Top 0.2: R11.2 D12.1 64.77,26.29 64.39,26.67 63.5,26.67 | D11.2 62.23,27.05 62.61,26.67 63.5,26.67 | 63.5,26.67 v63.5,25.4 | v36.58,33.91 33.66,36.83 U5.34
  Bottom 0.2: v63.5,25.4 58.42,25.4 55.88,22.86 53.24,22.86 43.08,33.02 37.47,33.02 v36.58,33.91
VBATT-0
  Top 0.2: 53.34,26.67 50.04,26.67 49.53,27.18 D6.2
  Top 0.305: M3.3 53.34,26.67 54.99,26.67 55.88,27.56 55.88,32.64 | D5.1 65.28,30.48 63.12,32.64 55.88,32.64 | 55.88,32.64 55.5,33.02 D4.1
VBATT-1  (via drill 0.4 pad 0.5)  (1 unrouted)
  Top 0.2: R3.1 40.64,12.06 41.27,11.43 v43.18,11.43 C2.2 | M6.2
  Top 0.305: U1.3 48.07,16.19 47.75,16.51 v46.99,16.51 | M6.2 R21.1 44.77,31.56 46.23,33.02 D4.2 | M6.2 44.77,26.86 44.96,26.67 46.48,26.67 47.12,26.04 47.12,24.51 48.39,23.24 v48.39,18.67
  Bottom 0.305: BAT1.UCC_2 46.99,6.35 43.18,10.16 v43.18,11.43 43.18,15.24 44.45,16.51 v46.99,16.51 48.39,17.91 v48.39,18.67
VBATT-2  (via drill 0.4 pad 0.5)  (1 unrouted)
  Top 0.2: 62.23,11.68 61.34,11.68 60.96,12.06 C5.2 | 62.23,11.68 63.12,11.68 63.5,12.06 R7.1 | 62.23,11.68 v62.23,11.76 | M5.2 R17.1 57.47,31.56 57.91,32 60.45,32 60.96,31.5 60.96,30.48
  Top 0.305: U3.3 54.04,14.29 52.96,13.21 52.96,7.75 54.61,6.1 BAT2.UCC_2 | D5.2 60.96,30.48 60.96,25.02 61.47,24.51 62.36,24.51 63.5,23.37 v63.5,21.46
  Bottom 0.2: v62.23,11.76 62.07,11.59
  Bottom 0.305: v63.5,21.46 R7.1 62.07,11.59 | v62.23,11.76 60.63,10.16 57.15,10.16 54.61,7.62 BAT2.UCC_2
VBUS  (via drill 0.35, 0.4 pad 0.5)
  Top 0.2: C1.2 45.72,11.68 46.23,11.18 v48.13,11.18 48.13,9.4 48.64,8.89 D1.A | U3.4 54.04,13.15 54.48,13.59 56.52,13.59 57.02,13.08 57.02,12.06 57.4,11.68 58.04,11.68 58.42,12.06 C4.2 | D2.A 53.98,10.79 v54.1,10.92
  Top 0.305: U1.4 48.13,12.51 v48.13,11.18 | U3.4 54.1,12.51 v54.1,10.92 | U5.40 34.29,52.07 36.45,49.91 38.04,49.91 C7.+ 40.96,49.85 41.91,50.8 44.45,50.8 | 44.45,50.8 53.34,50.8 54.61,49.53 54.61,36.83 52.07,34.29 v52.07,32.51 52.96,31.62 53.98,31.62 54.29,31.31 M3.1 | D3.1 44.45,50.8 | v55.18,24.83 55.69,24.32 55.69,18.99 v55.75,18.92
  Bottom 0.305: v48.13,11.18 51.05,11.18 51.31,10.92 v54.1,10.92 54.1,17.27 v55.75,18.92 | v52.07,32.51 53.34,31.24 53.34,26.8 55.24,24.89 v55.18,24.83
VDD-AP9101-1
  Top 0.2: C3.2 39.05,16.57 | U2.2 37.59,16.26 37.91,16.57 39.05,16.57 | 39.05,16.57 40.07,16.57 40.64,16 R3.2
VDD-AP9101-2
  Top 0.2: U4.2 66.42,16.26 66.99,16.83 C6.2 66.99,18.61 66.55,19.05 64.01,19.05 63.5,18.54 R7.2
VM1
  Top 0.2: R4.2 41.53,3.81 41.02,4.32 41.02,10.16 39.5,11.68 39.5,13.34 38.54,14.29 U2.1
VM2
  Top 0.2: U4.1 67.37,14.29 68.2,13.46 68.2,11.05 68.83,10.41 68.83,6.48 68.33,5.97 64.01,5.97 63.12,5.08 63.12,4.19 62.74,3.81 R8.2
VSYS  (via drill 0.35)
  Top 0.2: D6.1 50.8,30.31 | 50.8,30.31 M3.2 | 50.8,30.31 v50.8,29.21 | U5.39 34.29,49.53 v35.56,48.26
  Bottom 0.2: v50.8,29.21 43.18,36.83 43.18,43.18 38.1,48.26 v35.56,48.26

### Text on the board
tNames: Raspberry Pi Pico W | Sensor node max / v 1.0, 10/2023 | 3V3 | 2/6 | JLCJLCJLCJLC | 3/7 | 4/8 | 5/9 | G